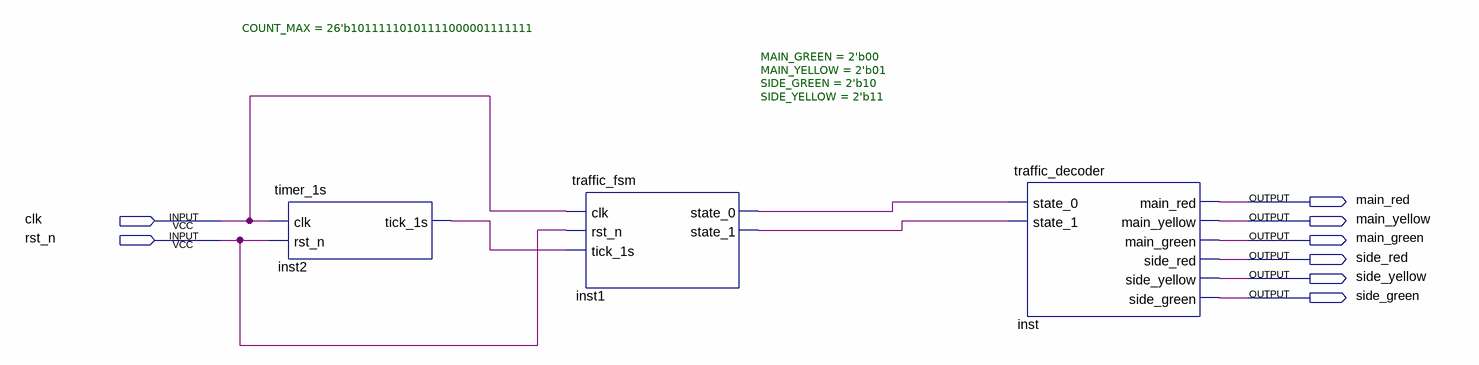
[diagram p0: schematic sheet]
// Quartus schematic Traffic_Light.bdf as structural Verilog: 3 symbols, 8 pins
module Traffic_Light (
  input  clk,
  input  rst_n,
  output main_red,
  output main_yellow,
  output main_green,
  output side_red,
  output side_yellow,
  output side_green
);

  wire inst1_state_0, inst1_state_1, inst2_tick_1s;

  timer_1s #(.COUNT_MAX(26'b10111110101111000001111111)) inst2 (.clk(clk), .rst_n(rst_n), .tick_1s(inst2_tick_1s));
  traffic_fsm #(.MAIN_GREEN(2'b00), .MAIN_YELLOW(2'b01), .SIDE_GREEN(2'b10), .SIDE_YELLOW(2'b11)) inst1 (
    .clk(clk), .rst_n(rst_n), .tick_1s(inst2_tick_1s), .state_0(inst1_state_0), .state_1(inst1_state_1));
  traffic_decoder inst (
    .state_0(inst1_state_0), .state_1(inst1_state_1), .main_red(main_red), .main_yellow(main_yellow),
    .main_green(main_green), .side_red(side_red), .side_yellow(side_yellow), .side_green(side_green));
endmodule
